# EasyEDA Pro project ProPrj_xl4015电源转接板_2026-11-04.epro

# Schematic Schematic1
Assembly Variant: Basic; Board Name: Board1; Create Date: 2026-09-22; Page Name: P1; Project Name: xl4015电源转接板; Schematic Name: Schematic1; Update Date: 2026-09-22; Company: 嘉立创EDA; Page Size: A4; Version: V1.0
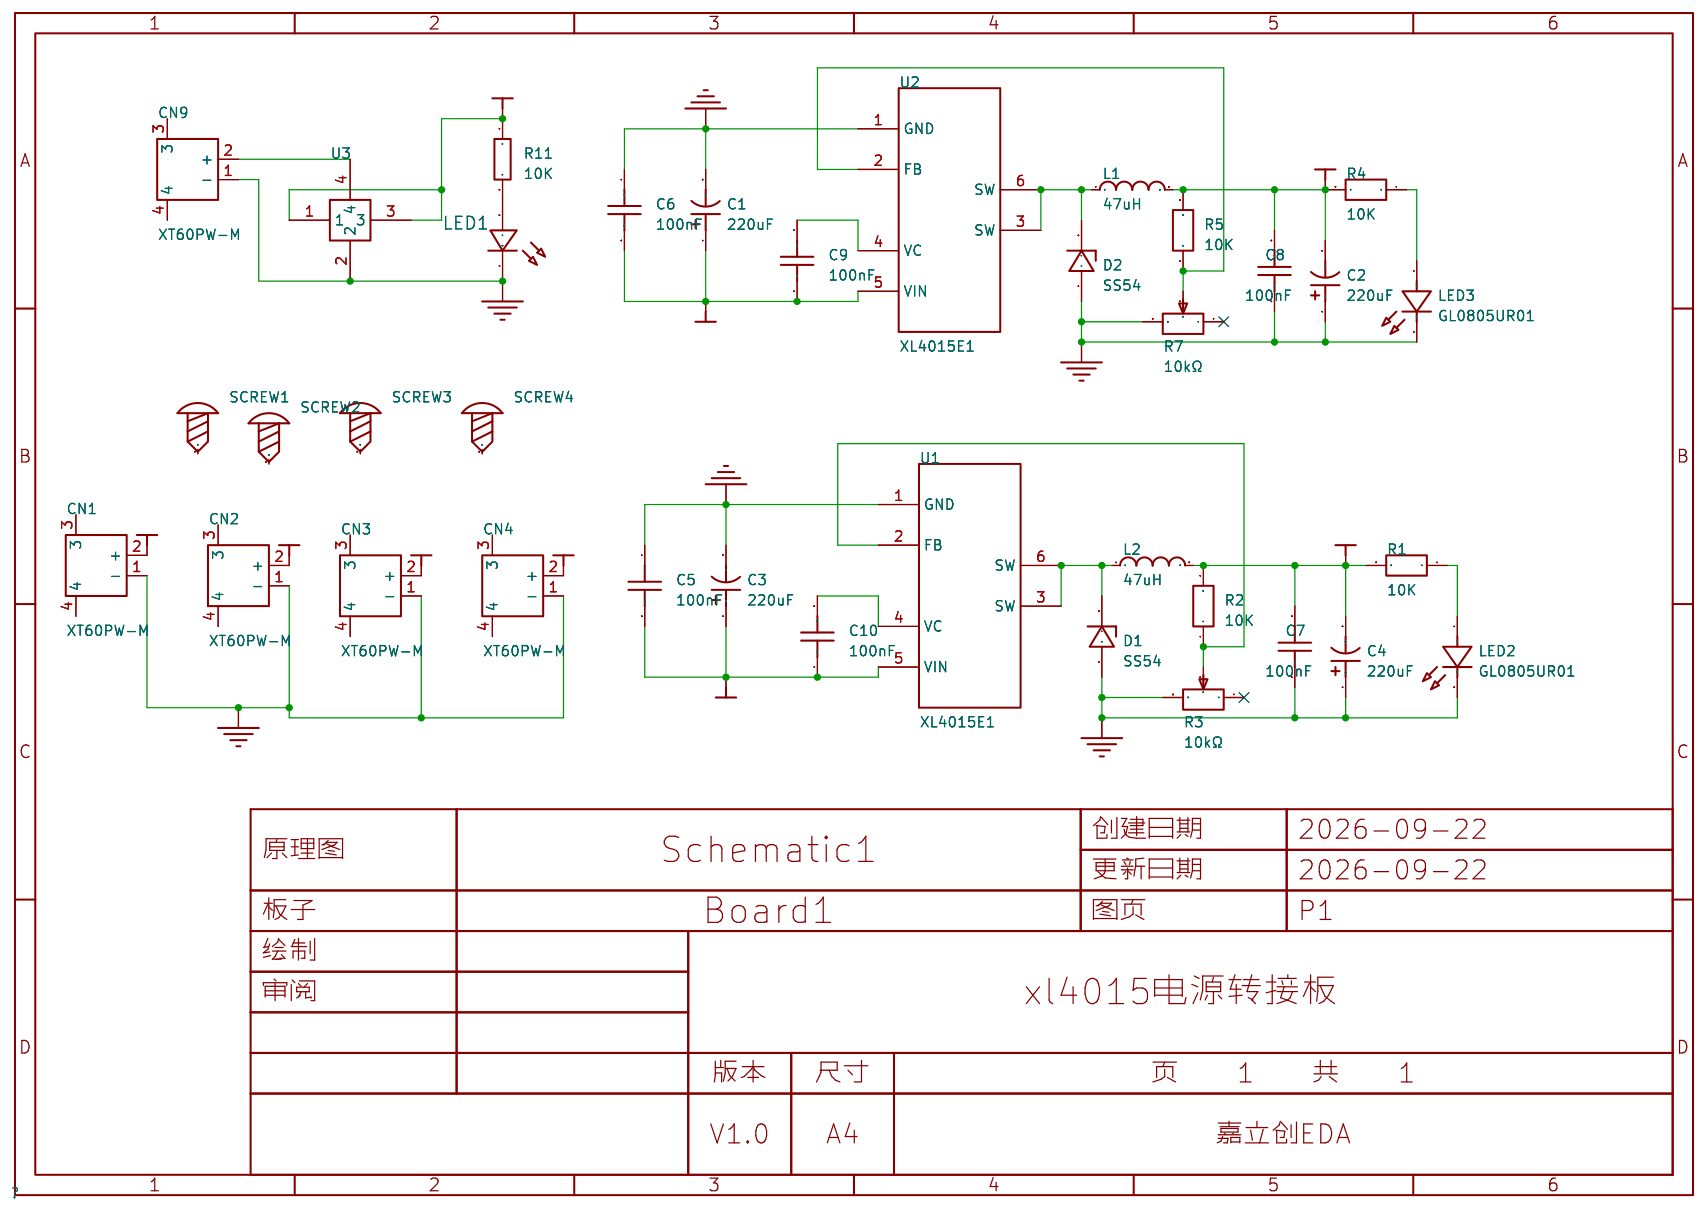
[diagram p0: schematic sheet]

## Parts
C1  220uF  [CAP-SMD_BD10.0-L10.3-W10.3-LS11.3-FD]
C2  220uF  [CAP-SMD_BD10.0-L10.3-W10.3-LS11.3-FD]
C3  220uF  [CAP-SMD_BD10.0-L10.3-W10.3-LS11.3-FD]
C4  220uF  [CAP-SMD_BD10.0-L10.3-W10.3-LS11.3-FD]
C5  100nF  [C0805]
C6  100nF  [C0805]
C7  100nF  [C0805]
C8  100nF  [C0805]
C9  100nF  [C0805]
C10  100nF  [C0805]
CN1  XT60PW-M  [CONN-TH_XT60PW-M]
CN2  XT60PW-M  [CONN-TH_XT60PW-M]
CN3  XT60PW-M  [CONN-TH_XT60PW-M]
CN4  XT60PW-M  [CONN-TH_XT60PW-M]
CN9  XT60PW-M  [CONN-TH_XT60PW-M]
D1  SS54  [SMA_L4.3-W2.6-LS5.0-FD]
D2  SS54  [SMA_L4.3-W2.6-LS5.0-FD]
L1  47uH  [IND-SMD_L11.5-W10.0_AAPS10A50]
L2  47uH  [IND-SMD_L11.5-W10.0_AAPS10A50]
LED1  -  [LED_0805]
LED2  GL0805UR01  [LED0805-R-RD_RED]
LED3  GL0805UR01  [LED0805-R-RD_RED]
R1  10K  [R0805]
R2  10K  [R0805]
R3  10kΩ  [RES-ADJ-TH_3296W]
R4  10K  [R0805]
R5  10K  [R0805]
R7  10kΩ  [RES-ADJ-TH_3296W]
R11  10K  [R0805]
SCREW1  -  [M4螺丝]
SCREW2  -  [M4螺丝]
SCREW3  -  [M4螺丝]
SCREW4  -  [M4螺丝]
U1  XL4015E1  [TO-263-5_L10.2-W8.9-P1.70-TL]
U2  XL4015E1  [TO-263-5_L10.2-W8.9-P1.70-TL]
U3  -  [金属按钮灯]

## Library data of the parts
C1-C4 = 126RV0004: 容值:220uF;精度:±20%;额定电压:50V;纹波电流:220mA@120Hz;等效串联电阻(ESR):-;; LCSC Part Name: 220uF ±20% 50V; Supplier Part: C5354991; Manufacturer: KNSCHA(科尼盛); Supplier Footprint: SMD,D10xL10.5mm; JLCPCB Part Class: Extended Part; Datasheet: https://item.szlcsc.com/datasheet/126RV0004/6154550.html; Supplier: LCSC; Tolerance: ±20%; Voltage Rating: 50V; Ripple Current: 220mA@120Hz; Diameter: 10mm; Height - Seated (Max): 10.5mm; Lifetime: 2000hrs@105℃; Operating Temperature: -55℃~+105℃
C5-C10 = FCC0805B104K500DT: 容值:100nF;精度:±10%;额定电压:50V;温度系数:X7R;; LCSC Part Name: 100nF ±10% 50V; Supplier Part: C5137467; Manufacturer: FOJAN(富捷); Supplier Footprint: 0805; JLCPCB Part Class: Extended Part; Datasheet: https://item.szlcsc.com/datasheet/FCC0805B104K500DT/5746969.html; Supplier: LCSC; Tolerance: ±10%; Voltage Rating: 50V; Temperature Coefficient: X7R; Operating Temperature: -55℃~+125℃
CN1-CN4 CN9 = XT60PW-M: 模型锂电连接器; LCSC Part Name: AMASS(艾迈斯)航模插头xt60连接器150公母对接pw锂电池公头 接PCB板卧式 黄色 公头XT60PW-M.G.Y; Supplier Part: C98732; Manufacturer: AMASS(艾迈斯); JLCPCB Part Class: Extended Part; Datasheet: https://item.szlcsc.com/datasheet/XT60PW-M/99942.html; Supplier: LCSC; colour: 黄色; Connector type: 卧式插头; interface form: 公头
D1 D2 = SS54_C7420369: 二极管配置:独立式;正向压降(Vf):550mV@5A;直流反向耐压(Vr):40V;整流电流:5A;; LCSC Part Name: 电压:40V 电流:5A; Supplier Part: C7420369; Manufacturer: R+O(宏嘉诚); Supplier Footprint: SMA(DO-214AC); JLCPCB Part Class: Extended Part; Datasheet: https://item.szlcsc.com/datasheet/SS54/8397191.html; Supplier: LCSC; Diode Configuration: 独立式; Voltage - Forward(Vf@If): 550mV@5A; Voltage - DC Reverse(Vr): 40V; Current - Rectified: 5A; Reverse Leakage Current (Ir): 50uA@40V; Operating Junction Temperature Range: -55℃~+125℃; Non-Repetitive Peak Forward Surge Current: 120A
L1 L2 = AAPS1040M470A: 电感值:47uH;精度:±20%;额定电流:3.33A;饱和电流(Isat):3.53A;; LCSC Part Name: 47uH ±20% 3.53A; Supplier Part: C47327363; Manufacturer: Coilank(驰兴电感); Supplier Footprint: SMD,11.5x10mm; JLCPCB Part Class: Extended Part; Datasheet: https://item.szlcsc.com/datasheet/AAPS1040M470A/49538291.html; Supplier: LCSC; Tolerance: ±20%; Current Rating: 3.33A; Current - Saturation(Isat): 3.53A; DC Resistance(DCR): 143mΩ
LED1 = LED_0805-R: Supplier Footprint: 0805
LED2 LED3 = GL0805UR01: 灯头类型:2mmx1.25mm方形灯头;发光颜色:红色;正向压降(Vf):1.8V~2.1V;功率:-;测试电流:20mA;波长:620nm~625nm;二极管配置:独立二极管;透镜颜色:无色透明透镜;色温:-;发光强度:80mcd~100mcd;发光角度:120°;载带方式:正贴;工作温度:-40℃~+85℃;; LCSC Part Name: 0805 红灯 高亮; Supplier Part: C51933307; Manufacturer: Guiguang light(桂光光电); Supplier Footprint: 0805; JLCPCB Part Class: Extended Part; Datasheet: https://item.szlcsc.com/datasheet/GL0805UR01/54646003.html; Supplier: LCSC; Lamp Holder Type: 2mmx1.25mm方形灯头; Illumination Color: 红色; Voltage - Forward(Vf): 1.8V~2.1V; Test Current: 20mA; Wavelength - Dominant: 620nm~625nm; Diode Configuration: 独立二极管; Lens Color: 无色透明透镜; Luminous Intensity: 80mcd~100mcd; Viewing Angle: 120°; Mounting Style: 正贴; Operating Temperature: -40℃~+85℃
R1 R2 R4 R5 = RE0805FAR000: 电阻类型:合金电阻;阻值:0Ω;精度:±1%;功率:500mW;温度系数:±50ppm/℃;安装方式:贴片;; LCSC Part Name: 0Ω 0.5W 0805 ±1%; Supplier Part: C51934133; Manufacturer: JIERR(捷而瑞); Supplier Footprint: 0805; JLCPCB Part Class: Extended Part; Datasheet: https://item.szlcsc.com/datasheet/RE0805FAR000/54649545.html; Supplier: LCSC; Type: 合金电阻; Tolerance: ±1%; Power(Watts): 500mW; Temperature Coefficient: ±50ppm/℃; Mounting Type: 贴片
R3 R7 = 3296W-1-103LF: 阻值:10kΩ;精度:±10%;功率:500mW;温度系数:±100ppm/℃;; LCSC Part Name: 10kΩ ±10%; Supplier Part: C34846; Manufacturer: BOURNS; Supplier Footprint: SIP-3P,9.5x4.8mm; JLCPCB Part Class: Extended Part; Datasheet: https://atta.szlcsc.com/upload/public/pdf/source/20151026/1457707506403.pdf; Supplier: LCSC; Tolerance: ±10%; Power(Watts): 500mW; Temperature Coefficient: ±100ppm/℃; Turns: 25
R11 = Res_0805: Supplier Footprint: 0805
SCREW1-SCREW4 = M4螺丝: Supplier Footprint: 插件
U1 U2 = XL4015E1: 功能类型:降压型;工作电压:8V~36V;输出电压:1.25V~32V;输出电流:5A;输出类型:可调;; LCSC Part Name: 降压型 5A 8V~36V; Supplier Part: C51661; Manufacturer: XLSEMI(芯龙); Supplier Footprint: TO-263-5; JLCPCB Part Class: Extended Part; Datasheet: https://item.szlcsc.com/datasheet/XL4015E1/52674.html; Supplier: LCSC; Function: 降压型; Voltage - Supply: 8V~36V; Output Voltage: 1.25V~32V; Output Current: 5A; Frequency - Switching: 180kHz; Operating Temperature: -40℃~+125℃; Synchronous Rectifier: 否; Number of Outputs: 1; Topology: 降压式; Quiescent Current: 5mA; Switch tube (built-in/external): 内置; Output Type: 可调; Features: 过流保护
U3 = 金属按钮灯

## Nets
GND: C1.2 C2.1 C3.2 C4.1 C5.1 C6.1 C7.1 C8.1 CN1.1(-) CN2.1(-) CN3.1(-) CN4.1(-) CN9.1(-) D1.1(A) D2.1(A) LED1.1(C) LED2.2(C) LED3.2(C) R3.3 R7.3 U1.1(GND) U2.1(GND) U3.2
VCC: C1.1 C3.1 C5.2 C6.2 C9.1 C10.1 R11.1 U1.5(VIN) U2.5(VIN) U3.1 U3.3
VOUT1: C2.2 C8.2 CN1.2(+) CN2.2(+) L1.2 R4.2 R5.2
VOUT2: C4.2 C7.2 CN3.2(+) CN4.2(+) L2.2 R1.2 R2.2
$1N3: LED1.2(A) R11.2
$1N24: C9.2 U2.4(VC)
$1N27: D2.2(K) L1.1 U2.3(SW) U2.6(SW)
$1N31: R5.1 R7.2 U2.2(FB)
$1N37: R2.1 R3.2 U1.2(FB)
$1N39: D1.2(K) L2.1 U1.3(SW) U1.6(SW)
$1N40: C10.2 U1.4(VC)
$1N41: LED2.1(A) R1.1
$1N50: CN9.2(+) U3.4
$1N57: LED3.1(A) R4.1

Not connected (* = marked no-connect by the designer): CN1 3 4; CN2 3 4; CN3 3 4; CN4 3 4; CN9 3 4; R3 1*; R7 1*; SCREW1 1; SCREW2 1; SCREW3 1; SCREW4 1

# Board PCB1
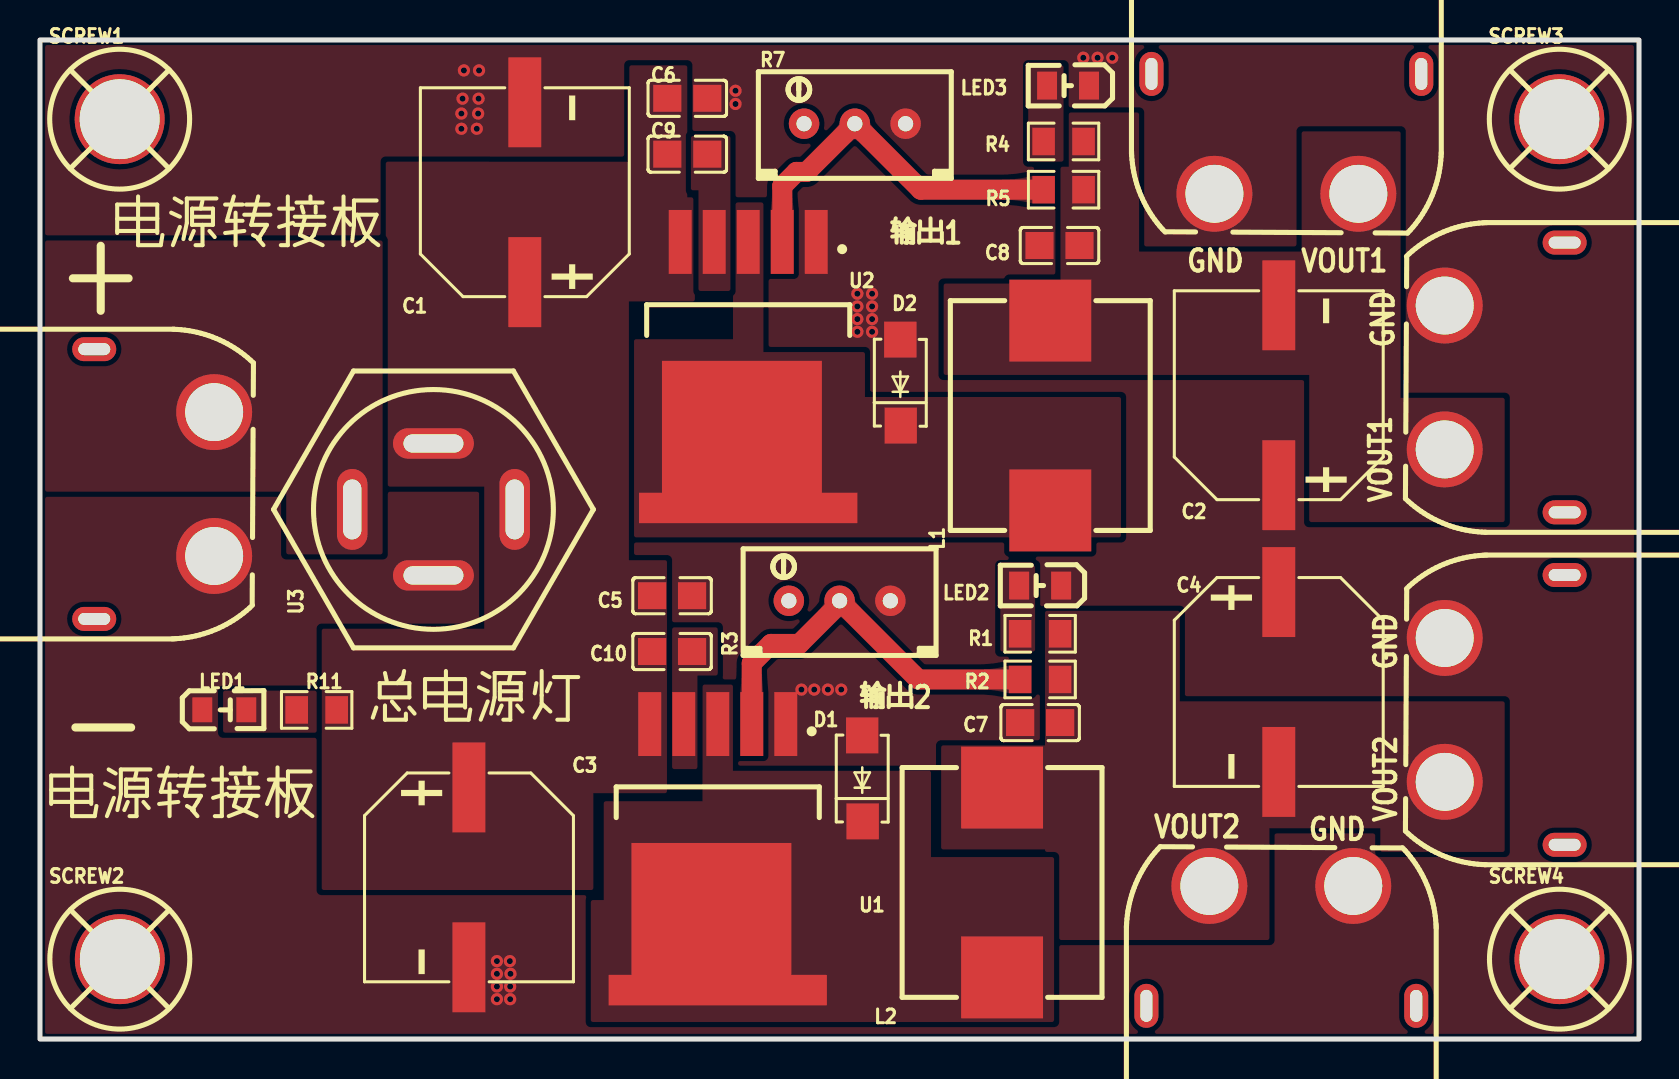
[diagram p1: board, top side]
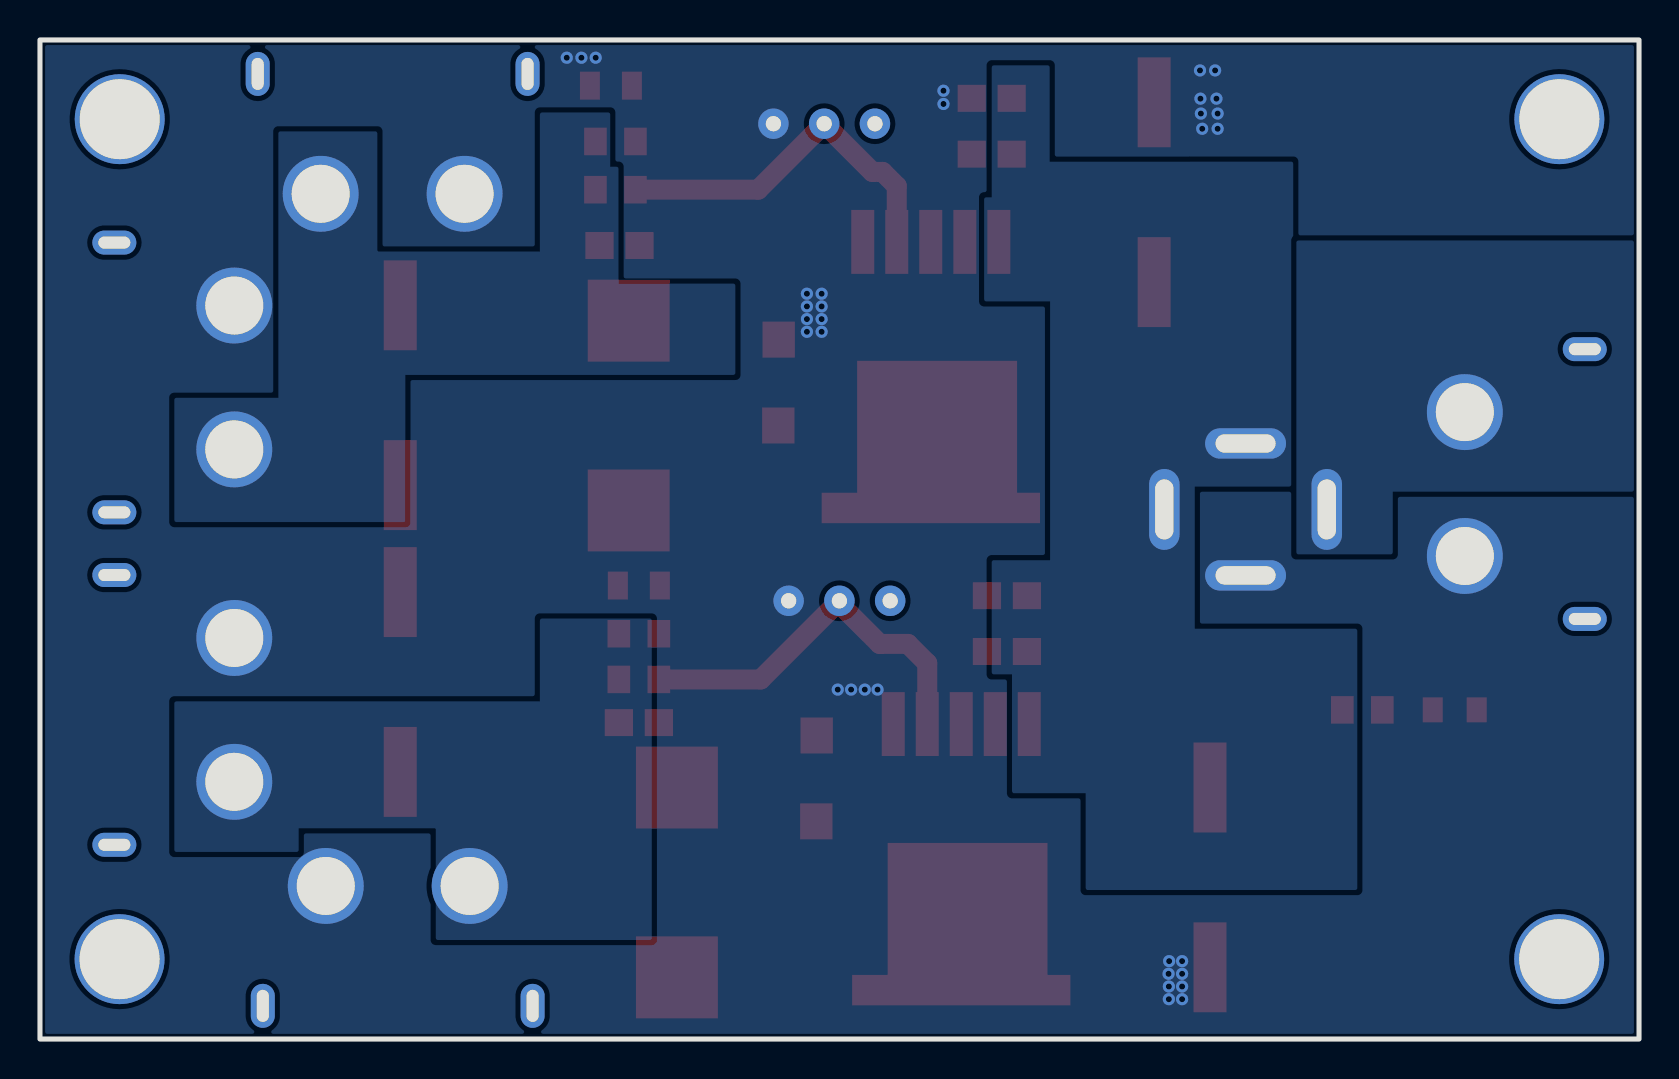
[diagram p2: board, bottom side, seen from below]

Outline 80 x 50 mm; copper layers: Top Layer, Bottom Layer. Coordinates in mm from the lower left corner of the outline.
Outline path: rectangle 0,50 80,0
Stack: Top Layer 0.035mm / Dielectric1 1.51mm FR4 er 4.5 / Bottom Layer 0.035mm

## Design rules (mm)
spacing copperThickness1oz (default): track to track 0.102, other pairs 0.152 to 0.3
spacing copperThickness2oz: track to track 0.203, other pairs 0.152 to 0.3
track width copperThickness1oz (default): min 0.127, default 0.254, max 2.54
track width copperThickness2oz: min 0.203, default 0.254, max 2.54
differential pair differentialPair (default): width min 0.127, default 0.254, max 2.54; gap min 0.152, default 0.152
net $1N50 uses copperRegion
net VCC uses copperRegion
net VOUT1 uses copperRegion
net VOUT2 uses copperRegion
net $1N24 uses copperRegion
net $1N40 uses copperRegion
net $1N39 uses copperRegion
net $1N27 uses copperRegion
net $1N3 uses copperRegion
net $1N41 uses copperRegion
net $1N57 uses copperRegion

## Placement (name value [footprint] x y rotation side)
C1  220uF  [CAP-SMD_BD10.0-L10.3-W10.3-LS11.3-FD]  24.26 42.38 90 top
C2  220uF  [CAP-SMD_BD10.0-L10.3-W10.3-LS11.3-FD]  61.98 32.22 90 top
C3  220uF  [CAP-SMD_BD10.0-L10.3-W10.3-LS11.3-FD]  21.46 8.09 270 top
C4  220uF  [CAP-SMD_BD10.0-L10.3-W10.3-LS11.3-FD]  61.98 17.87 270 top
C5  100nF  [C0805]  31.62 22.19 180 top
C6  100nF  [C0805]  32.39 47.08 180 top
C7  100nF  [C0805]  50.04 15.84 0 top
C8  100nF  [C0805]  51.01 39.71 0 top
C9  100nF  [C0805]  32.39 44.28 0 top
C10  100nF  [C0805]  31.62 19.39 0 top
CN1  XT60PW-M  [CONN-TH_XT60PW-M]  73.28 33.11 180 top
CN2  XT60PW-M  [CONN-TH_XT60PW-M]  62.36 45.3 270 top
CN3  XT60PW-M  [CONN-TH_XT60PW-M]  62.1 4.66 90 top
CN4  XT60PW-M  [CONN-TH_XT60PW-M]  73.28 16.47 180 top
CN9  XT60PW-M  [CONN-TH_XT60PW-M]  5.71 27.77 0 top
D1  SS54  [SMA_L4.3-W2.6-LS5.0-FD]  41.15 13.04 270 top
D2  SS54  [SMA_L4.3-W2.6-LS5.0-FD]  43.05 32.85 270 top
L1  47uH  [IND-SMD_L11.5-W10.0_AAPS10A50]  50.55 31.2 90 top
L2  47uH  [IND-SMD_L11.5-W10.0_AAPS10A50]  48.13 7.84 90 top
LED1  -  [LED_0805]  9.27 16.47 0 top
LED2  GL0805UR01  [LED0805-R-RD_RED]  50.04 22.69 180 top
LED3  GL0805UR01  [LED0805-R-RD_RED]  51.43 47.71 180 top
R1  10K  [R0805]  50.04 20.28 0 top
R2  10K  [R0805]  50.04 18 0 top
R3  10kΩ  [RES-ADJ-TH_3296W]  40 21.93 90 top
R4  10K  [R0805]  51.21 44.92 0 top
R5  10K  [R0805]  51.21 42.51 0 top
R7  10kΩ  [RES-ADJ-TH_3296W]  40.77 45.81 90 top
R11  10K  [R0805]  13.84 16.47 180 top
SCREW1  -  [M4螺丝]  3.99 46.04 0 top
SCREW2  -  [M4螺丝]  3.99 4 0 top
SCREW3  -  [M4螺丝]  76.01 46.04 0 top
SCREW4  -  [M4螺丝]  76.02 4 0 top
U1  XL4015E1  [TO-263-5_L10.2-W8.9-P1.70-TL]  33.91 10.76 270 top
U2  XL4015E1  [TO-263-5_L10.2-W8.9-P1.70-TL]  35.43 34.89 270 top
U3  -  [金属按钮灯]  19.68 26.5 270 top

## Footprints (pads in the part's own frame, mm; a bottom-side part is the same pattern mirrored in y, then rotated)
C0805
  rect 1.41x1.35 smd: 1(-1,0) 2(1,0)
CAP-SMD_BD10.0-L10.3-W10.3-LS11.3-FD
  rect 4.5x1.65 smd: 1(-4.5,0) 2(4.5,0)
CONN-TH_XT60PW-M
  round 3.8 hole 2.9: 1(3,-3.6) 2(3,3.6)
  oval 2.2x1.2 hole 1.6x0.6: 3(-3,6.75) 4(-3,-6.75)
IND-SMD_L11.5-W10.0_AAPS10A50
  rect 4.1x4.1 smd: 1(-4.75,0) 2(4.75,0)
LED0805-R-RD_RED
  rect 1x1.399 smd: 1(1.05,0) 2(-1.05,0)
LED_0805
  rect 1x1.25 smd: 1(-1.15,0.005) 2(1.05,0.005)
M4螺丝
  round 4.5 hole 4: 1(0,0)
R0805
  rect 1.133x1.377 smd: 1(-1,0) 2(1,0)
RES-ADJ-TH_3296W
  round 1.524 hole 0.762: 1(0,2.54) 2(0,0) 3(0,-2.54)
SMA_L4.3-W2.6-LS5.0-FD
  rect 1.8x1.62 smd: 1(-2.15,-0.009) 2(2.15,0.009)
TO-263-5_L10.2-W8.9-P1.70-TL
  rect 3.2x1.15 smd: 1(-5.008,3.404) 2(-5.008,1.702) 3(-5.008,0) 4(-5.008,-1.702) 5(-5.008,-3.404)
  custom 8.128x10.922 smd: 6(5.008,-0.318)
金属按钮灯
  oval 1.524x4.048 hole 0.914x3: 1(-3.302,0) 2(3.302,0)
  oval 4.048x1.524 hole 3x0.914: 3(0,4.064) 4(0,-4.064)

## Nets
As in the schematic.

Pads without a net: CN1 3 4; CN2 3 4; CN3 3 4; CN4 3 4; CN9 3 4; R3 1; R7 1; SCREW1 1; SCREW2 1; SCREW3 1; SCREW4 1

## Via types
v1: diameter 0.61, hole 0.305, Top Layer to Bottom Layer, 33 vias

## Routing (per net, layer and track width the routed paths; a pad name or vN(x,y) marks a point on that pad's centre or on a via; arc(x,y) is an arc through that point)
GND:
  vias: v1(21.14,47.06) v1(21.08,46.32) v1(21.08,45.55) v1(21.21,48.48) v1(21.85,45.55) v1(21.97,48.48) v1(21.94,47.06) v1(21.92,46.32) v1(22.86,3.9) v1(22.86,3.26) v1(22.86,2.63) v1(22.86,1.99) v1(23.51,3.9) v1(23.54,3.26) v1(23.52,2.63) v1(23.52,1.99) v1(34.8,47.46) v1(34.8,46.8) v1(38.1,17.49) v1(38.73,17.49) v1(39.42,17.49) v1(40.09,17.49) v1(40.89,37.3) v1(40.89,36.66) v1(40.89,36.03) v1(40.89,35.39) v1(41.63,37.3) v1(41.63,36.66) v1(41.63,36.03) v1(41.63,35.39) v1(52.2,49.11) v1(52.91,49.11) v1(53.65,49.11)
$1N31: length 18.5
  Top Layer w1: U2.2 37.14,42.68 37.85,43.4 38.35,43.4 R7.2 44.07,42.51 R5.1
$1N37: length 19.3
  Top Layer w1: R2.1 43.94,18 40.08,21.86 37.99,19.77 36.58,19.77 35.61,18.81 U1.2

## Copper pours and planes (outline as drawn; the poured copper is in the pictures)
GND on Top Layer: 0,50 80,50 80,0 0,0
GND on Bottom Layer: -0.06,50.03 79.94,50.03 79.94,0.03 -0.06,0.03
GND on Bottom Layer: 0,49.96 80,49.96 80,-0.04 0,-0.04
VCC on Top Layer: 22.48,43.9 29.48,43.9 29.48,48.73 32.39,48.73 32.39,42.13 32.76,42.13 32.76,36.92 29.46,36.92 29.46,23.96 31.37,23.96 31.37,12.3 27.69,12.3 27.69,7.45 14.1,7.45 14.1,20.54 22.23,20.54 22.23,27.65 17.3,27.65 17.3,43.91 22.47,43.91
VCC on Bottom Layer: 22.48,43.9 29.48,43.9 29.48,48.73 32.39,48.73 32.39,42.13 32.76,42.13 32.76,36.92 29.46,36.92 29.46,23.96 32.39,23.96 32.39,18.25 31.37,18.25 31.37,12.3 27.69,12.3 27.69,7.45 14.1,7.45 14.1,20.54 22.23,20.54 22.23,27.65 17.3,27.65 17.3,43.91 22.47,43.91
VOUT1 on Top Layer: 51.05,37.81 51.05,43.66 51.47,43.66 51.47,46.37 54.99,46.37 54.99,39.41 63.07,39.41 63.12,39.46 63.12,45.43 68.07,45.43 68.07,32.09 73.28,32.09 73.28,25.87 63.5,25.87 63.5,33.24 45.21,33.24 45.21,37.81
VOUT1 on Bottom Layer: 51.05,37.81 51.05,43.66 51.47,43.66 51.47,46.37 54.99,46.37 54.99,39.41 63.07,39.41 63.12,39.46 63.12,45.43 68.07,45.43 68.07,32.09 73.28,32.09 73.28,25.87 61.72,25.87 61.72,33.24 45.21,33.24 45.21,37.81
VOUT2 on Top Layer: 45.08,14.69 53.98,14.69 53.98,9.49 45.08,9.49
VOUT2 on Top Layer: 50.28,21.43 57.02,21.43 57.02,16.9 73.28,16.9 73.28,9.36 67.06,9.36 67.06,10.54 61.51,10.54 61.51,4.96 50.28,4.96
VOUT2 on Bottom Layer: 49.39,21.05 54.99,21.05 54.99,16.9 73.28,16.9 73.28,9.36 67.06,9.36 67.06,10.54 60.24,10.54 60.2,10.5 60.2,4.96 49.39,4.96
$1N3 on Top Layer: 9.16,17.44 13.84,17.44 13.84,15.33 9.16,15.33
$1N24 on Top Layer: 34.53,45.19 34.54,45.17 34.54,37.44 32.95,37.44 32.95,42.48 32.57,42.48 32.57,45.19
$1N27 on Top Layer: 36.2,41.87 36.2,34.38 41.27,34.38 41.27,32.13 54.08,32.13 54.08,25.11 29.56,25.11 29.56,35.03 34.67,35.03 34.67,41.87
$1N39 on Top Layer: 34.42,13.42 44.58,13.42 44.58,8.22 34.42,8.22
$1N39 on Top Layer: 33.15,17.74 34.67,17.74 34.67,9.11 50.73,9.11 50.73,0.85 27.56,0.85 27.56,6.95 28.21,6.95 28.21,11.89 28.19,11.9 33.15,11.9
$1N40 on Top Layer: 33.91,20.6 33.91,18.19 32.89,18.19 32.89,13.51 31.5,13.51 31.5,20.6
$1N41 on Top Layer: 48.05,23.71 49.78,23.71 49.78,19.39 48.05,19.39
$1N50 on Top Layer: 17.14,39.97 17.14,24.26 12.32,24.26 12.32,27.39 0.25,27.39 0.25,39.97
$1N50 on Bottom Layer: 17.14,39.97 17.14,24.26 12.32,24.26 12.32,27.39 0.25,27.39 0.25,39.97
$1N57 on Top Layer: 49.44,48.73 51.21,48.73 51.21,43.91 49.44,43.91

Small or netless copper shapes (teardrops, artwork), in the pictures only: 8 on Top Layer

## Text on the board
Top Silkscreen Layer: VOUT2 | GND | VOUT1 | + | - | 输出2 | 输出1 | 电源转接板 | 总电源灯
